# Altium schematic sheet INA229功率计.SchDoc
size A4; SheetNumber: 1; SheetTotal: 1
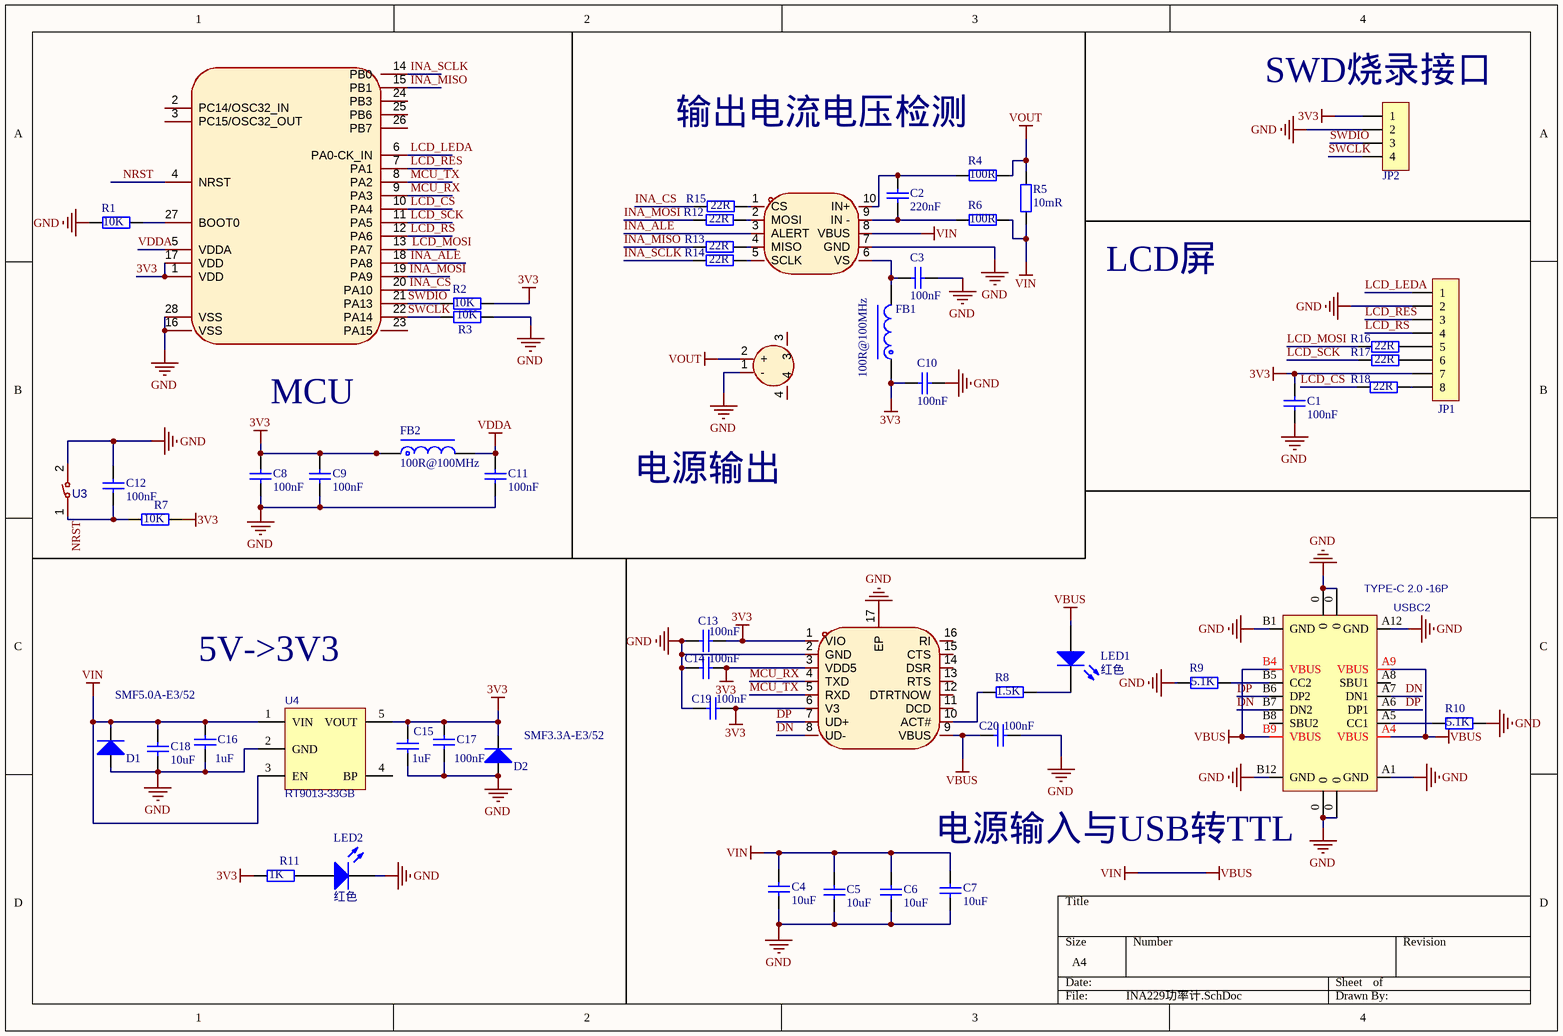
[diagram p0: INA229功率计.SchDoc]

## Parts
C1  100nF  [C0402_L]
C2  220nF  [C0402_L]
C3  100nF  [C0402_L]
C4  10uF  [C0402_L]
C5  10uF  [C0402_L]
C6  10uF  [C0402_L]
C7  10uF  [C0402_L]
C8  100nF  [C0402_L]
C9  100nF  [C0402_L]
C10  100nF  [C0402_L]
C11  100nF  [C0402_L]
C12  100nF  [C0402_L]
C13  100nF  [C0402_L]
C14  100nF  [C0402_L]
C15  1uF  [C0402_L]
C16  1uF  [C0402_L]
C17  100nF  [C0402_L]
C18  10uF  [C0402_L]
C19  100nF  [C0402_L]
C20  100nF  [C0402_L]
CN1  XT30PW-M  [CONN-TH_XT30PW-M]  (value not drawn)
D1  SMF5.0A-E3/52  [SOD-123]
D2  SMF3.3A-E3/52  [SOD-123]
FB1  100R@100MHz  [FB0402]
FB2  100R@100MHz  [FB0402]
JP1  CON-8P  [FPC0.5-WT-8P]  (value not drawn)
JP2  HDR-1X4  [HDR1.27-LI-4P]  (value not drawn)
LED1  红色  [LED0402_W]
LED2  红色  [LED0402_W]
R1  10K  [R0402_L]
R2  10K  [R0402_L]
R3  10K  [R0402_L]
R4  100R  [R0402_L]
R5  10mR  [R2512_M]
R6  100R  [R0402_L]
R7  10K  [R0402_L]
R8  1.5K  [R0402_L]
R9  5.1K  [R0402_L]
R10  5.1K  [R0402_L]
R11  1K  [R0402_L]
R12  22R  [R0201_L]
R13  22R  [R0201_L]
R14  22R  [R0201_L]
R15  22R  [R0201_L]
R16  22R  [R0201_L]
R17  22R  [R0201_L]
R18  22R  [R0201_L]
U1  STM32L031G6U6  [UFQFPN-28_L4.0-W4.0-P0.50-BL]  (value not drawn)
U2  INA229AIDGSR  [VSSOP-10_L3.0-W3.0-P0.50-LS4.9-BL]  (value not drawn)
U3  ZX-QC34-2TPDZ  [KEY-SMD_L3.9-W3.0-LS5.0-EH]  (value not drawn)
U4  RT9013-33GB  [SOT-23-5]
U5  CH343P  [TQFN-16_L3.0-W3.0-P0.50-BL-EP1.7]  (value not drawn)
USBC2  TYPE-C 2.0 -16P  [USB-C-SMD_16P]

## Nets
3V3: C1.2 C8.2 C9.2 C10.2 C13.1 C14.1 C15.2 C17.2 C19.1 D2.2(K) FB1.1 FB2.1 JP1.7 JP2.1 R2.1 R7.2 R11.1 U1.1(VDD) U1.17(VDD) U4.5(VOUT) U5.1(VIO) U5.3(VDD5) U5.6(V3)
GND: C1.1 C3.1 C4.1 C5.1 C6.1 C7.1 C8.1 C9.1 C10.1 C11.1 C12.2 C13.2 C14.2 C15.1 C16.1 C17.1 C18.1 C19.2 C20.1 CN1.1(-) D1.1(A) D2.1(A) JP1.2 JP2.2 LED2.2(K) R1.2 R3.1 R9.2 R10.1 U1.16(VSS) U1.28(VSS) U2.7(GND) U3.2 U4.2(GND) U5.2(GND) U5.17(EP) USBC2.0 USBC2.A1(GND) USBC2.A12(GND) USBC2.B1(GND) USBC2.B12(GND)
VBUS: C4.2 C5.2 C6.2 C7.2 C16.2 C18.2 C20.2 D1.2(K) LED1.1(A) R5.1 R6.1 U2.8(VBUS) U4.1(VIN) U4.3(EN) U5.9(VBUS) USBC2.A4(VBUS) USBC2.A9(VBUS) USBC2.B4(VBUS) USBC2.B9(VBUS)  [also labelled VIN]
VDDA: C11.2 FB2.2 U1.5(VDDA)
VOUT: CN1.2(+) R4.1 R5.2
DN: U5.8(UD-) USBC2.A7(DN1) USBC2.B7(DN2)
DP: U5.7(UD+) USBC2.A6(DP1) USBC2.B6(DP2)
INA_ALE: U1.18(PA8) U2.3(ALERT)
INA_CS: R15.1 U1.20(PA10)
INA_MISO: R13.1 U1.15(PB1)
INA_MOSI: R12.1 U1.19(PA9)
INA_SCLK: R14.1 U1.14(PB0)
LCD_CS: R18.1 U1.10(PA4)
LCD_LEDA: JP1.1 U1.6(PA0-CK_IN)
LCD_MOSI: R16.1 U1.13(PA7)
LCD_RES: JP1.3 U1.7(PA1)
LCD_RS: JP1.4 U1.12(PA6)
LCD_SCK: R17.1 U1.11(PA5)
MCU_RX: U1.9(PA3) U5.4(TXD)
MCU_TX: U1.8(PA2) U5.5(RXD)
NRST: C12.1 R7.1 U1.4(NRST) U3.1
SWCLK: JP2.4 R3.2 U1.22(PA14)
SWDIO: JP2.3 R2.2 U1.21(PA13)
NetC2_1: C2.1 R6.2 U2.9(IN_-)
NetC2_2: C2.2 R4.2 U2.10(IN+)
NetC3_2: C3.2 FB1.2 U2.6(VS)
NetJP1_5: JP1.5 R16.2
NetJP1_6: JP1.6 R17.2
NetJP1_8: JP1.8 R18.2
NetLED1_2: LED1.2(K) R8.1
NetLED2_1: LED2.1(A) R11.2
NetR1_1: R1.1 U1.27(BOOT0)
NetR8_2: R8.2 U5.10(ACT#)
NetR9_1: R9.1 USBC2.B5(CC2)
NetR10_2: R10.2 USBC2.A5(CC1)
NetR12_2: R12.2 U2.2(MOSI)
NetR13_2: R13.2 U2.4(MISO)
NetR14_2: R14.2 U2.5(SCLK)
NetR15_2: R15.2 U2.1(CS)

Not connected (* = marked no-connect by the designer): CN1 3 4; U1 2(PC14/OSC32_IN) 3(PC15/OSC32_OUT) 23(PA15) 24(PB3) 25(PB6) 26(PB7); U4 4(BP); U5 11(DCD) 12(DTRTNOW) 13(RTS) 14(DSR) 15(CTS) 16(RI); USBC2 A8(SBU1) B8(SBU2)

## Notes on the sheet
- (near JP2) SWD烧录接口
- 输出电流电压检测
- LCD屏
- MCU
- 电源输出
- 5V->3V3
- (near C7) 电源输入与USB转TTL

## Library data of the parts
C1-C20 = C: 贴片电容/MLCC电容; BOM名称: 无极性贴片电容; 当前库版本V2022.12.25 @淘宝卖家:黄晶宝石: 最新版本发布https://shop463601444.taobao.com
D1 D2 = TVS: TVS通用; 当前库版本V2022.12.25 @淘宝卖家:黄晶宝石: 最新版本发布https://shop463601444.taobao.com
FB1 FB2 = FB: 贴片磁珠; BOM名称: 直插磁珠; 联系下单店铺卖家 免费帮你查找封装: 联系下单店铺卖家 免费技术支持
JP1 = Header 8: 8P连接器; 封装库来自淘宝卖家: 黄晶宝石: 最新版本发布https://shop463601444.taobao.com; BOM名称: 8P连接器
JP2 = Header 4: 4P连接器; 联系卖家 免费查找封装: 唯一出售店铺网址https://shop463601444.taobao.com; BOM名称: 4P连接器
LED1 LED2 = LED: 贴片LED; 封装库来自淘宝卖家：黄晶宝石: 其他店铺购入均为盗版封装库，无更新权益，请立即申请退款，本店现金奖励200~1000元; BOM名称: 贴片LED
R1-R18 = R: 贴片电阻; 联系下单店铺卖家 免费帮你查找封装: 联系下单店铺卖家 免费技术支持; BOM名称: 贴片电阻
U4 = RT9193-30GB: LDO 3.0V/0.3A; 当前库版本V2022.12.25 @淘宝卖家:黄晶宝石: 最新版本发布https://shop463601444.taobao.com; BOM名称: RT9193-30GB
USBC2 = USB2.0_Type-C_16Pin: USB2.0_Type-C_16Pin母座; 当前库版本V2022.12.25 @淘宝卖家:黄晶宝石: 最新版本发布https://shop463601444.taobao.com
CN1 = XT30PW-M: Symbol: XT30PW-M
U1 = STM32L031G6U6: Symbol: STM32L031G6U6
U2 = INA229AIDGSR: Symbol: INA229AIDGSR
U3 = ZX-QC34-2TPDZ: Symbol: ZX-QC34-2TPDZ
U5 = CH343P: Symbol: CH343P